# EasyEDA schematic demo-easyeda-sch.json
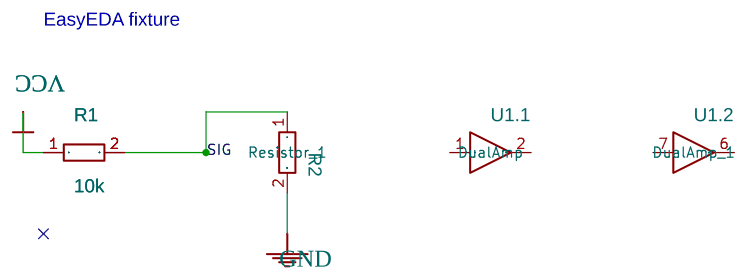
[diagram p0: schematic sheet]

## Parts
R1  10k  [R0603]
R2  -  [R0603]
U1  -  [SOIC-8]  (sections 1,2)

## Library data of the parts
R1 = Resistor: Manufacturer: Acme
R2 = Resistor
U1 = DualAmp

## Nets
GND: R2.2
VCC: R1.1
SIG: R1.2 R2.1

Not connected (* = marked no-connect by the designer): U1 1 2 6 7

## Notes on the sheet
- EasyEDA fixture
